# Altium project Mach_RFID.PrjPcb
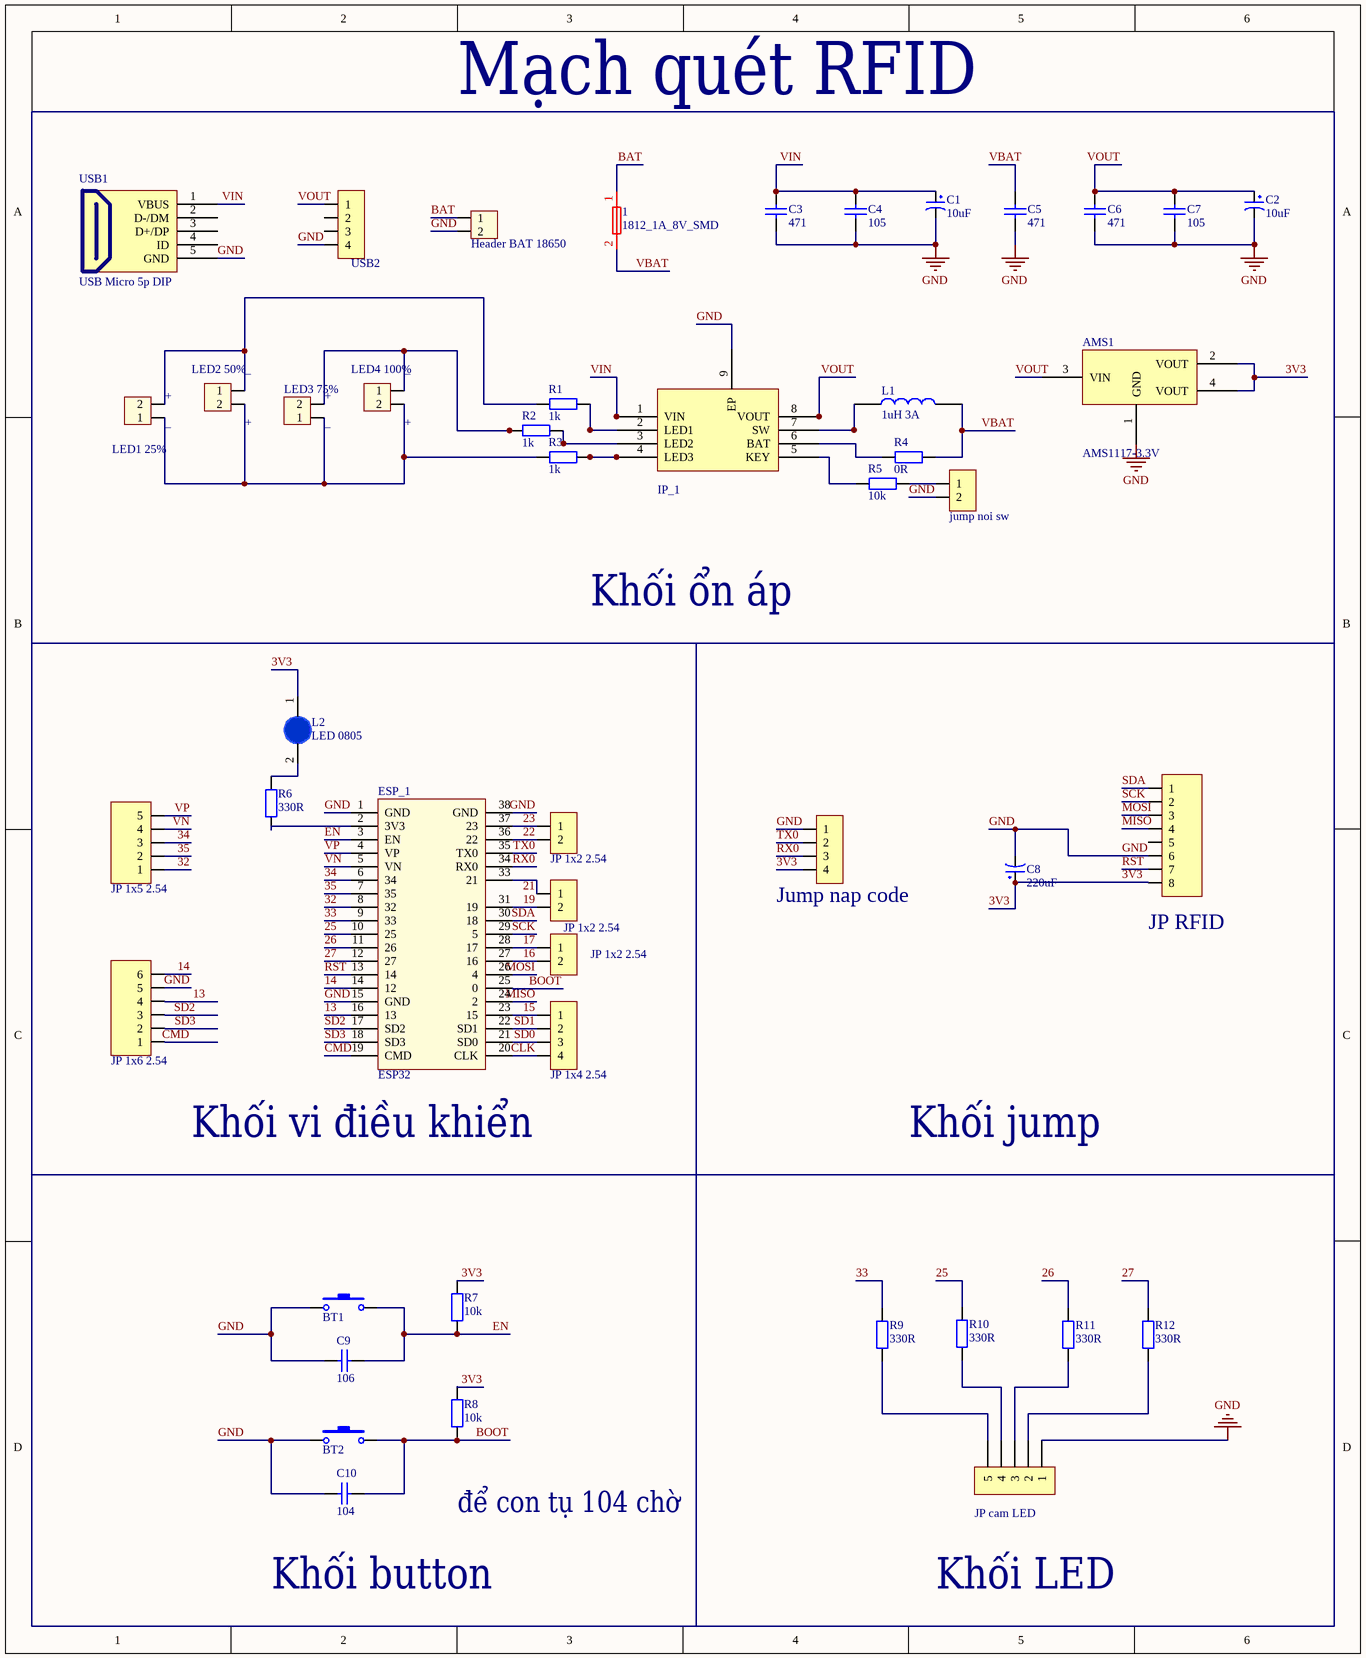
[diagram p0: Schematic_RFID.SchDoc]
1 sheet, 47 parts. Net scope: global (net labels, ports and power ports of the same name join across sheets).
Board file: PCB._RFID.PcbDoc

## Sheet Schematic_RFID.SchDoc
size 255 x 309 mm; SheetNumber: 1; SheetTotal: 1

### Parts
1  1812_1A_8V_SMD  [1812_1A_8V_SMD]
AMS1  AMS1117-3.3V  [SOT223]
BT1  Nut Nhan 2 Chan SMD 3x6x2.5  [Nut Nhan 2 Chan SMD 3x6x2.5]  (value not drawn)
BT2  Nut Nhan 2 Chan SMD 3x6x2.5  [Nut Nhan 2 Chan SMD 3x6x2.5]  (value not drawn)
C1  10uF  [tu hoa 4mm]
C2  10uF  [tu hoa 4mm]
C3  471  [tu 0805]
C4  105  [tu 0805]
C5  471  [tu 0805]
C6  471  [tu 0805]
C7  105  [tu 0805]
C8  220uF  [tu hoa 10mm]
C9  106  [tu 0805]
C10  104  [tu 0805]
ESP_1  ESP32  [ESP32_chip]
H1  Header BAT 18650  [XH2.54M-2]
H2  LED1 25%  [XH2.54M-2]
H3  LED2 50%  [XH2.54M-2]
H4  LED4 100%  [XH2.54M-2]
H5  LED3 75%  [XH2.54M-2]
H6  JP cam LED  [XH2.54M-5]
IP_1  IP5306  [IP5306]  (value not drawn)
JP1  USB2  [JP 1x4 DT]
JP2  jump noi sw  [JP 1x2 DT]
JP3  JP RFID  [JP 1x8 DC]
JP4  JP 1x5 2.54  [JP 1x5 DT]
JP5  JP 1x2 2.54  [JP 1x2 DT]
JP6  Jump nap code  [JP 1x4 DT]
JP7  JP 1x2 2.54  [JP 1x2 DT]
JP8  JP 1x2 2.54  [JP 1x2 DT]
JP9  JP 1x6 2.54  [JP 1x6 DT]
JP10  JP 1x4 2.54  [JP 1x4 DT]
L1  1uH 3A  [CUON CAM 100uH3A]
L2  LED 0805  [LED-0805-Blue]
R1  1k  [tro smd 0805]
R2  1k  [tro smd 0805]
R3  1k  [tro smd 0805]
R4  0R  [tro smd 0805]
R5  10k  [tro smd 0805]
R6  330R  [Tro SMD 0805]
R7  10k  [tro smd 0805]
R8  10k  [tro smd 0805]
R9  330R  [Tro SMD 0805]
R10  330R  [Tro SMD 0805]
R11  330R  [Tro SMD 0805]
R12  330R  [Tro SMD 0805]
USB1  USB Micro 5p DIP  [USB Micro 5p DIP]

### Nets
GND: AMS1.1(GND) BT1.1 BT2.1 C1.2 C2.2 C3.1 C4.2 C5.1 C6.1 C7.2 C8.2 C9.2 C10.2 ESP_1.1(GND) ESP_1.15(GND) ESP_1.38(GND) H1.2 H6.1 IP_1.9(EP) JP1.4 JP2.2 JP3.6 JP6.1 JP9.5 USB1.5(GND)
3V3: AMS1.2(VOUT) AMS1.4(VOUT) C8.1 JP3.8 JP6.4 L2.1(A) R7.2 R8.2
13: ESP_1.16(13) JP9.4
14: ESP_1.14(12) JP9.6
15: ESP_1.23(15) JP10.1
16: ESP_1.27(16) JP8.2
17: ESP_1.28(17) JP8.1
19: ESP_1.31(19) JP7.2
21: ESP_1.33(21) JP7.1
22: ESP_1.36(22) JP5.2
23: ESP_1.37(23) JP5.1
25: ESP_1.10(25) R10.1
26: ESP_1.11(26) R11.1
27: ESP_1.12(27) R12.1
32: ESP_1.8(32) JP4.1
33: ESP_1.9(33) R9.1
34: ESP_1.6(34) JP4.3
35: ESP_1.7(35) JP4.2
BAT: 1.1 H1.1
BOOT: BT2.2 C10.1 ESP_1.25(0) R8.1
CLK: ESP_1.20(CLK) JP10.4
CMD: ESP_1.19(CMD) JP9.1
EN: BT1.2 C9.1 ESP_1.3(EN) R7.1
MISO: ESP_1.24(2) JP3.4
MOSI: ESP_1.26(4) JP3.3
RST: ESP_1.13(14) JP3.7
RX0: ESP_1.34(RX0) JP6.3
SCK: ESP_1.29(5) JP3.2
SD0: ESP_1.21(SD0) JP10.3
SD1: ESP_1.22(SD1) JP10.2
SD2: ESP_1.17(SD2) JP9.3
SD3: ESP_1.18(SD3) JP9.2
SDA: ESP_1.30(18) JP3.1
TX0: ESP_1.35(TX0) JP6.2
VBAT: 1.2 C5.2 L1.2 R4.2
VIN: C1.1 C3.2 C4.1 IP_1.1(VIN) USB1.1(VBUS)
VN: ESP_1.5(VN) JP4.4
VOUT: AMS1.3(VIN) C2.1 C6.2 C7.1 IP_1.8(VOUT) JP1.1
VP: ESP_1.4(VP) JP4.5
NetESP_1_2: ESP_1.2(3V3) R6.2
NetH2_1: H2.1 H3.2 H4.2 H5.1 R3.1
NetH2_2: H2.2 H3.1 R1.1
NetH4_1: H4.1 H5.2 R2.1
NetH6_2: H6.2 R12.2
NetH6_3: H6.3 R11.2
NetH6_4: H6.4 R10.2
NetH6_5: H6.5 R9.2
NetIP_1_2: IP_1.2(LED1) R1.2
NetIP_1_3: IP_1.3(LED2) R2.2
NetIP_1_4: IP_1.4(LED3) R3.2
NetIP_1_5: IP_1.5(KEY) R5.1
NetIP_1_6: IP_1.6(BAT) R4.1
NetIP_1_7: IP_1.7(SW) L1.1
NetJP2_1: JP2.1 R5.2
NetL2_2: L2.2(K) R6.1

Not connected (* = marked no-connect by the designer): JP1 2 3; JP3 5; USB1 2(D-/DM) 3(D+/DP) 4(ID)

### Notes on the sheet
- Mạch quét RFID
- (near H2) +
- (near H3) _
- (near H5) +
- (near H4) _
- (near H2) _
- (near H3) +
- (near H5) _
- (near H4) +
- Khối ổn áp
- Khối vi điều khiển
- Khối jump
- để con tụ 104 chờ
- Khối button
- Khối LED

### Library data of the parts
AMS1 = AMS1117 SMD: Dán; Value: AMS1117-3.3V SOT223; Don_Vi: Con; Ma_Hang: MH000596; Ghi_Chu: *; Kieu_Chan: *; Chung_Loai: Dán
BT1 BT2 = Nut Nhan 2 Chan SMD 3x6x2.5: Ma_Hang: MH001036; Ten: Nút Nhấn 2 Chân 3x6x2.5MM SMD
C1 C2 = Tu Hoa 10uF 25V 4x7: Cắm; So_Chan: 2; Ten_Linh_Kien: Tụ Hóa 10uF 25V 4x7MM; Don_Vi: Con; Ma_Hang: MH001349; Chung_Loai: Cắm; Kieu_Chan: *
C3 C5 C6 = Tu 0805 471 50V 10%: Dán; Don_Vi: Con; So_Chan: 2; Ten_Linh_Kien: Tụ 0805 471-470 10% 50V; Ma_Hang: MH004564; Chung_Loai: Dán; Kieu_Chan: *
C4 C7 = Tu 0805 105 50V 10%: Dán; Don_Vi: Con; So_Chan: 2; Ten_Linh_Kien: Tụ 0805 105-1uF 10% 50V; Ma_Hang: MH004552; Chung_Loai: Dán; Kieu_Chan: *
C8 = Tu Hoa 220uF 50V 10x14: Cắm; Don_Vi: Con; So_Chan: 2; Ten_Linh_Kien: Tụ Hóa 220uF 50V; Ma_Hang: MH006873; Chung_Loai: Cắm; Kieu_Chan: *
C9 = Tu 0805 106 16V 10%: Dán; Ten_Linh_Kien: Tụ 0805 106-10uF 10% 16V; So_Chan: 2; Don_Vi: Con; Ma_Hang: MH004553; Chung_Loai: Dán; Kieu_Chan: *
C10 = Tu 0805 104 50V 10%: Dán; Don_Vi: Con; So_Chan: 2; Ten_Linh_Kien: Tụ 0805 104-100nF 10% 50V; Ma_Hang: MH004551; Chung_Loai: Dán; Kieu_Chan: *
ESP_1 = ESP32_CHIP
H1-H5 = Header 2P 2.54 Duc Thang: Cắm; Ten_Linh_Kien: Header 2P XH2.54-2P Đực Thẳng; Don_Vi: Con; Ma_Hang: MH001283; Chung_Loai: Cắm
H6 = Header 5P 2.54 Duc Thang: Cắm; Ten_Linh_Kien: Header 5P XH2.54-5P Đực Thẳng; Don_Vi: Con; Ma_Hang: MH001298; Chung_Loai: Cắm
JP1 JP6 JP10 = JP 1x4 2.54 Duc Thang: Cắm; Ten_Linh_Kien: Jump Đơn Đực 2.54MM 1x40P Thẳng 11MM; Don_Vi: Con; Ma_Hang: MH000903; Ghi_Chu: *; Kieu_Chan: *; Chung_Loai: Cắm
JP2 JP5 JP7 JP8 = JP 1x2 2.54 Duc Thang: Cắm; Ten_Linh_Kien: Jump Đơn Đực 2.54MM 1x40P Thẳng 11MM; Don_Vi: Con; Ma_Hang: MH000903; Ghi_Chu: *; Kieu_Chan: *; Chung_Loai: Cắm
JP3 = JP 1x8 2.54 Duc Cong: Cắm; Ten_Linh_Kien: Jump Đơn Đực 2.54MM 1x40P Cong Đứng; Don_Vi: Con; Ma_Hang: MH000904; Ghi_Chu: *; Kieu_Chan: *; Chung_Loai: Cắm
JP4 = JP 1x5 2.54 Duc Thang: Cắm; Ten_Linh_Kien: Jump Đơn Đực 2.54MM 1x40P Thẳng 11MM; Don_Vi: Con; Ma_Hang: MH000903; Ghi_Chu: *; Kieu_Chan: *; Chung_Loai: Cắm
JP9 = JP 1x6 2.54 Duc Thang: Cắm; Ten_Linh_Kien: Jump Đơn Đực 2.54MM 1x40P Thẳng 11MM; Don_Vi: Con; Ma_Hang: MH000903; Ghi_Chu: *; Kieu_Chan: *; Chung_Loai: Cắm
L1 = CUON CAM 100uH DIP: Dán; Don_Vi: Con; Ma_Hang: MH002209; Ten_Linh_Kien: Cuộn Cảm 100uH 3A 8x10MM; Chung_Loai: Dán; Ghi Chu: *; Kieu Chan: *
L2 = LED 0805 Xanh Duong: Dán; Don_Vi: Con; Ma_Hang: MH002327; Ten_Linh_Kien: LED 0805 Màu Xanh Dương (Blue); Ghi_Chu: *; Kieu_Chan: *; Chung_Loai: Dán
R1-R3 = Tro 0805 1% 1k: Dán; Don_Vi: Con; So_Chan: 2; Ten_Linh_Kien: Trở 0805 1% 1k; Ma_Hang: MH005468; Chung_Loai: Dán; Kieu_Chan: *
R4 = Tro 0805 5% 0R: Dán; Don_Vi: Con; So_Chan: 2; Ten_Linh_Kien: Trở 0805 5% 0R; Ma_Hang: MH005230; Chung_Loai: Dán; Kieu_Chan: *
R5 = Tro 0805 5% 10k: Dán; Don_Vi: Con; So_Chan: 2; Ten_Linh_Kien: Trở 0805 5% 10k; Ma_Hang: MH005239; Chung_Loai: Dán; Kieu_Chan: *
R6 R9-R12 = Tro 0805 5% 330R: Dán; Don_Vi: Con; So_Chan: 2; Ten_Linh_Kien: Trở 0805 5% 330R; Ma_Hang: MH005337; Chung_Loai: Dán; Kieu_Chan: *
R7 R8 = Tro 0805 1% 10k: Dán; Don_Vi: Con; So_Chan: 2; Ten_Linh_Kien: Trở 0805 1% 10k; Ma_Hang: MH005473; Chung_Loai: Dán; Kieu_Chan: *
USB1 = USB Micro 5p DIP: USB Type B; Ten: MicroUSB MK5P DIP; Ma_Hang: MH005145